# Altium schematic sheet StepperPower.SchDoc (part 1 of 2)
size A4; SheetNumber: 2; SheetTotal: 7
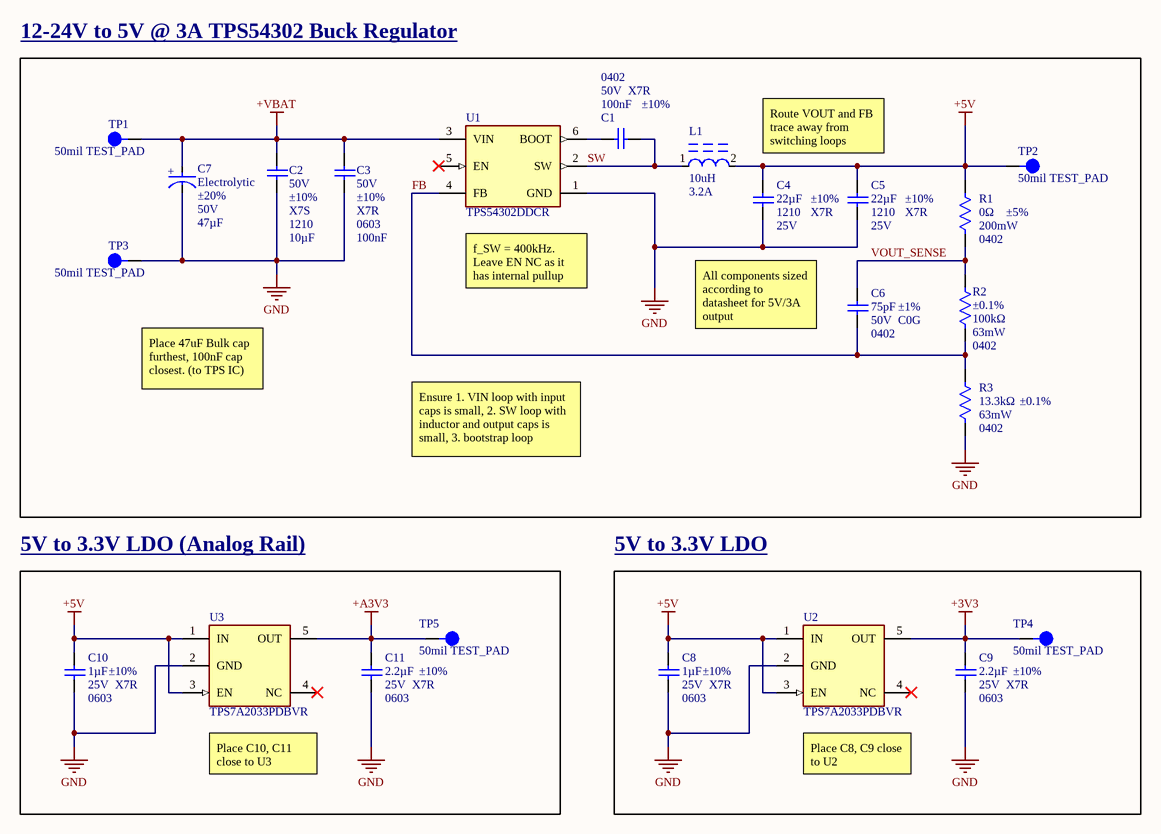
[diagram p0: StepperPower.SchDoc]

## Parts
C1  Case/Package: 0402  Voltage Rating: 50V  Dielectric: X7R  Tolerance: ±10%  [0402_Cap]  (hidden comment: 100nF)
C2  Voltage Rating: 50V  Tolerance: ±10%  Dielectric: X7S  Case/Package: 1210  Capacitance: 10µF  [1210_CAP]  (hidden comment: 10uF)
C3  Voltage Rating: 50V  Tolerance: ±10%  Dielectric: X7R  Case/Package: 0603  [0603_CAP]  (hidden comment: 100nF)
C4  Dielectric: X7R  Voltage: 25V  Tolerance: ±10%  Case/Package: 1210  Capacitance: 22µF  [1210_CAP]  (hidden comment: 22uF)
C5  Dielectric: X7R  Voltage: 25V  Tolerance: ±10%  Case/Package: 1210  Capacitance: 22µF  [1210_CAP]  (hidden comment: 22uF)
C6  Dielectric Material: C0G  Voltage Rating: 50V  Tolerance: ±1%  Case/Package: 0402  [0402_Cap]  (hidden comment: 75pF)
C7  Dielectric: Electrolytic  Tolerance: ±20%  Voltage Rating: 50V  [ELECTROLYTIC_CAP]  (hidden comment: 47µF)
C8  Voltage: 25V  Tolerance: ±10%  Dielectric: X7R  Case/Package: 0603  Capacitance: 1µF  [0603_CAP]  (hidden comment: 1uF)
C9  2.2µF  Dielectric Material: X7R  Voltage Rating: 25V  Tolerance: ±10%  Case/Package: 0603  [0603_CAP]
C10  Voltage: 25V  Tolerance: ±10%  Dielectric: X7R  Case/Package: 0603  Capacitance: 1µF  [0603_CAP]  (hidden comment: 1uF)
C11  2.2µF  Dielectric Material: X7R  Voltage Rating: 25V  Tolerance: ±10%  Case/Package: 0603  [0603_CAP]
L1  10uH  Current Rating: 3.2A  [FP-SRN6045TA-MFG]
R1  Tolerance: ±5%  Power Rating: 200mW  Case/Package: 0402  Resistance: 0Ω  [0402_RES]  (hidden comment: 0R)
R2  Tolerance: ±0.1%  Resistance: 100kΩ  Max Power Dissipation: 63mW  Case Code (Imperial): 0402  [0402_RES]  (hidden comment: 100K)
R3  Tolerance: ±0.1%  Max Power Dissipation: 63mW  Case/Package: 0402  Resistance: 13.3kΩ  [0402_RES]  (hidden comment: 13K3)
TP1  50mil TEST_PAD  [15mil_TEST_PAD]
TP2  50mil TEST_PAD  [15mil_TEST_PAD]
TP3  50mil TEST_PAD  [15mil_TEST_PAD]
TP4  50mil TEST_PAD  [15mil_TEST_PAD]
TP5  50mil TEST_PAD  [15mil_TEST_PAD]
U1  TPS54302DDCR  [FP-DDC0006A-MFG]
U2  TPS7A2033PDBVR  [FP-DBV0005A-MFG]
U3  TPS7A2033PDBVR  [FP-DBV0005A-MFG]

## Blocks framed on the sheet
12-24V to 5V @ 3A TPS54302 Buck Regulator: C1-C7 L1 R1-R3 TP1-TP3 U1
5V to 3.3V LDO (Analog Rail): C10 C11 TP5 U3
5V to 3.3V LDO: C8 C9 TP4 U2

## Nets
+3V3: C9.2 TP4.1 U2.5(OUT)
+5V: C4.2 C5.2 C8.2 C10.2 L1.2 R1.2 TP2.1 U2.1(IN) U2.3(EN) U3.1(IN) U3.3(EN)
+A3V3: C11.2 TP5.1 U3.5(OUT)
+VBAT: C2.2 C3.2 C7.1(A) TP1.1 U1.3(VIN)
GND: C2.1 C3.1 C4.1 C5.1 C7.2(C) C8.1 C9.1 C10.1 C11.1 R3.1 TP3.1 U1.1(GND) U2.2(GND) U3.2(GND)
FB: C6.1 R2.1 R3.2 U1.4(FB)
SW: C1.1 L1.1 U1.2(SW)
VOUT_SENSE: C6.2 R1.1 R2.2
NetC1_2: C1.2 U1.6(BOOT)

Not connected (* = marked no-connect by the designer): U1 5(EN)*; U2 4(NC)*; U3 4(NC)*

## Notes on the sheet
- Route VOUT and FB trace away from switching loops
- (near U1) f_SW = 400kHz. Leave EN NC as it has internal pullup
- All components sized according to datasheet for 5V/3A output
- Place 47uF Bulk cap furthest, 100nF cap closest. (to TPS IC)
- Ensure 1. VIN loop with input caps is small, 2. SW loop with inductor and output caps is small, 3. bootstrap loop
- (near U3) Place C10, C11 close to U3
- (near U2) Place C8, C9 close to U2
- (in symbol 865080645012) +